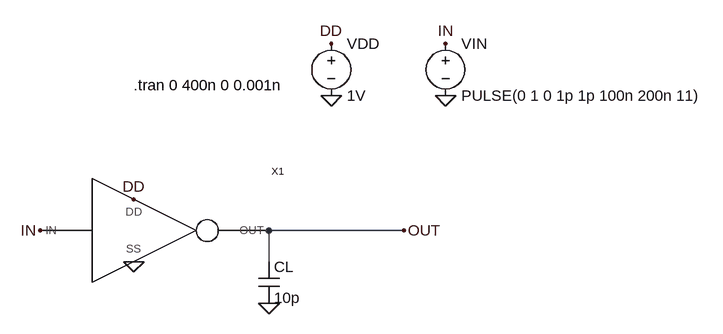
[diagram p0: schematic 3a.asc]
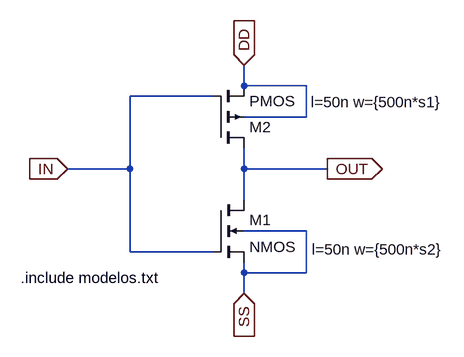
[diagram p1: sub-circuit inversorp3.asc]
3a.asc, the LTspice schematic file:
Version 4
SHEET 1 980 680
WIRE 496 176 288 176
WIRE 288 224 288 176
FLAG 80 224 0
FLAG -64 176 IN
FLAG 80 128 DD
FLAG 384 -32 0
FLAG 560 -32 0
FLAG 384 -112 DD
FLAG 560 -112 IN
FLAG 496 176 OUT
FLAG 288 288 0
SYMBOL voltage 384 -128 R0
SYMATTR InstName VDD
SYMATTR Value 1V
SYMBOL voltage 560 -128 R0
WINDOW 123 0 0 Left 0
WINDOW 39 0 0 Left 0
SYMATTR InstName VIN
SYMATTR Value PULSE(0 1 0 1p 1p 100n 200n 11)
SYMBOL cap 272 224 R0
SYMATTR InstName CL
SYMATTR Value 10p
SYMBOL inversorp3 16 176 R0
SYMATTR InstName X1
TEXT 80 -48 Left 2 !.tran 0 400n 0 0.001n

inversorp3.asc, the sub-circuit schematic file:
Version 4
SHEET 1 1048 680
WIRE 112 32 112 0
WIRE 208 32 112 32
WIRE 64 48 -64 48
WIRE 208 80 208 32
WIRE 208 80 112 80
WIRE -64 160 -64 48
WIRE -64 160 -160 160
WIRE 112 160 112 128
WIRE 240 160 112 160
WIRE 112 208 112 160
WIRE 208 256 112 256
WIRE -64 288 -64 160
WIRE 64 288 -64 288
WIRE 112 320 112 304
WIRE 208 320 208 256
WIRE 208 320 112 320
WIRE 112 352 112 320
FLAG 112 0 DD
IOPIN 112 0 In
FLAG -160 160 IN
IOPIN -160 160 In
FLAG 240 160 OUT
IOPIN 240 160 Out
FLAG 112 352 SS
IOPIN 112 352 In
SYMBOL nmos4 64 208 R0
WINDOW 123 152 76 Left 2
WINDOW 0 56 31 Left 2
SYMATTR Value2 l=50n w={500n*s2}
SYMATTR InstName M1
SYMBOL pmos4 64 128 M180
WINDOW 123 151 71 Left 2
SYMATTR Value2 l=50n w={500n*s1}
SYMATTR InstName M2
TEXT -232 328 Left 2 !.include modelos.txt

The netlist it stands for:
* 3a.asc
VDD DD 0 1V
VIN IN 0 PULSE(0 1 0 1p 1p 100n 200n 11)
CL OUT 0 10p
XX1 DD 0 IN OUT inversorp3 params: s1=2, s2=1

* block symbol definitions
.subckt inversorp3 DD SS IN OUT
M1 OUT IN SS SS NMOS l=50n w={500n*s2}
M2 OUT IN DD DD PMOS l=50n w={500n*s1}
.include modelos.txt
.ends inversorp3

.model NMOS NMOS
.model PMOS PMOS
.lib standard.mos
.tran 0 400n 0 0.001n
.backanno
.end